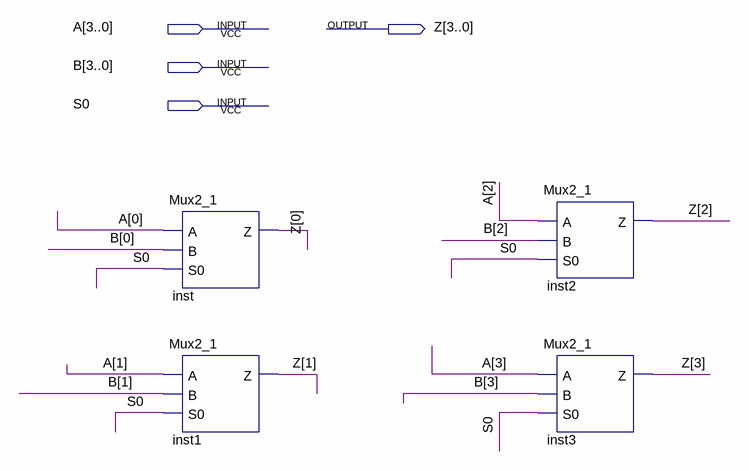
[diagram p0: schematic sheet]
// Quartus schematic Mux21_4b.bdf as structural Verilog: 4 symbols, 4 pins
module Mux21_4b (
  input  [3:0] A,
  input  [3:0] B,
  input  S0,
  output [3:0] Z
);

  Mux2_1 inst (.A(A[0]), .B(B[0]), .S0(S0), .Z(Z[0]));
  Mux2_1 inst1 (.A(A[1]), .B(B[1]), .S0(S0), .Z(Z[1]));
  Mux2_1 inst2 (.A(A[2]), .B(B[2]), .S0(S0), .Z(Z[2]));
  Mux2_1 inst3 (.A(A[3]), .B(B[3]), .S0(S0), .Z(Z[3]));
endmodule
